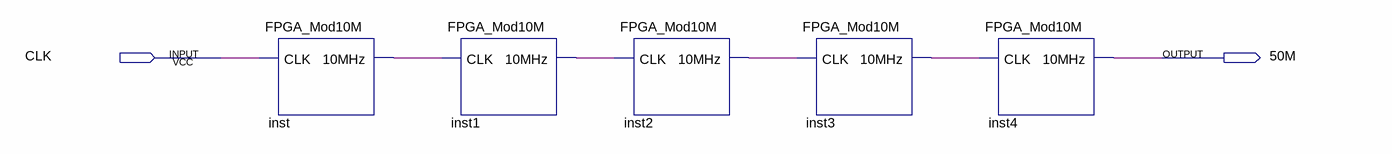
[diagram p0: schematic sheet]
// Quartus schematic FPGA_Mod50M.bdf as structural Verilog: 5 symbols, 2 pins
module FPGA_Mod50M (
  input  CLK,
  output \50M 
);

  wire inst1_10mhz, inst2_10mhz, inst3_10mhz, inst_10mhz;

  FPGA_Mod10M inst (.CLK(CLK), .\10MHz (inst_10mhz));
  FPGA_Mod10M inst1 (.CLK(inst_10mhz), .\10MHz (inst1_10mhz));
  FPGA_Mod10M inst2 (.CLK(inst1_10mhz), .\10MHz (inst2_10mhz));
  FPGA_Mod10M inst3 (.CLK(inst2_10mhz), .\10MHz (inst3_10mhz));
  FPGA_Mod10M inst4 (.CLK(inst3_10mhz), .\10MHz (\50M ));
endmodule
